# Altium schematic sheet SkeinTwisterRevE.SchDoc
size A
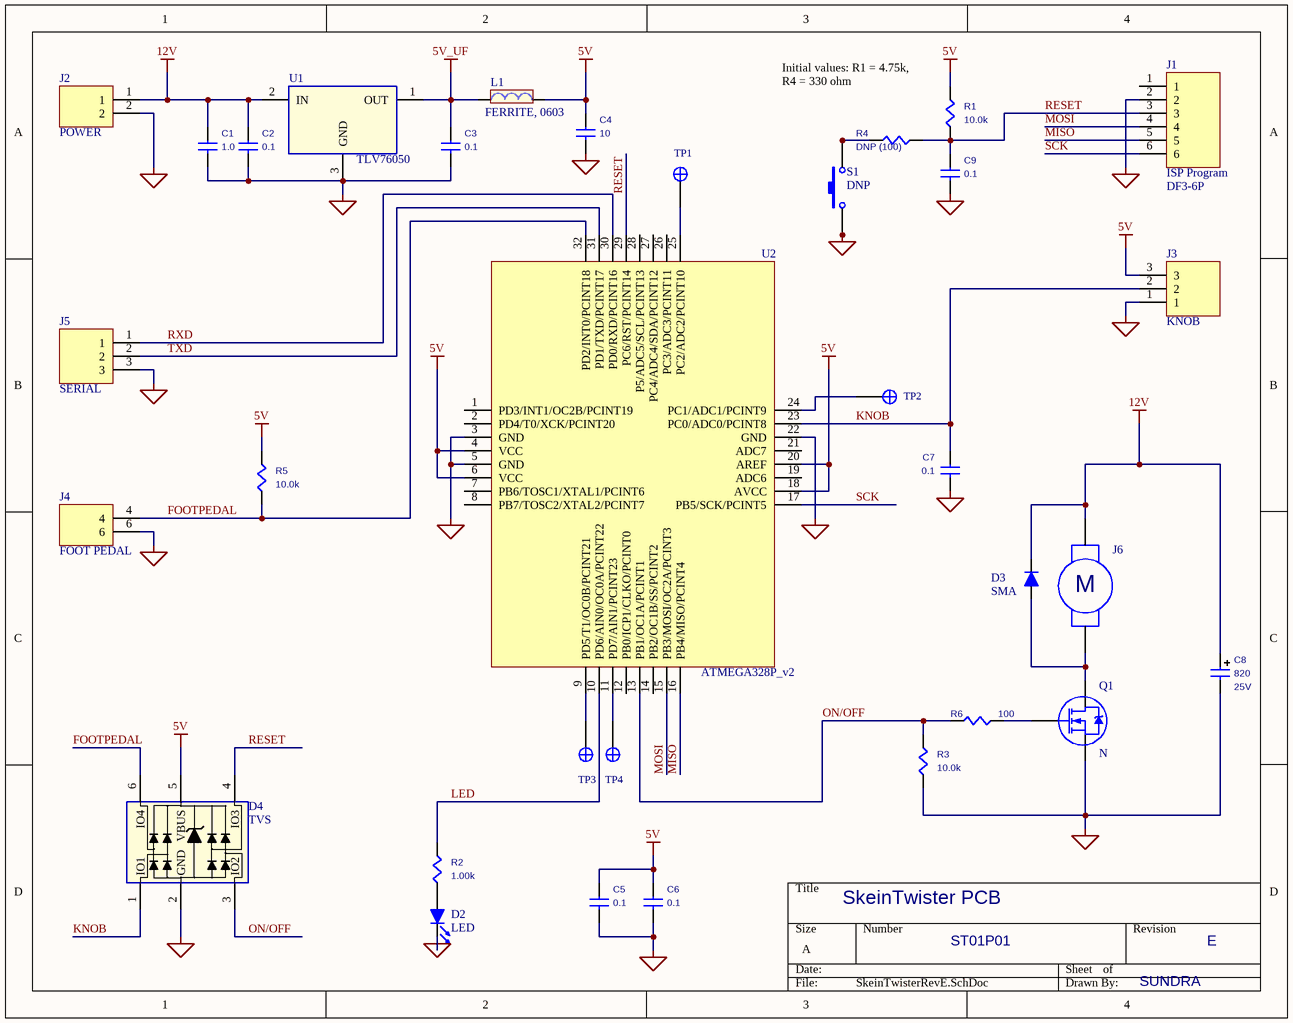
[diagram p0: SkeinTwisterRevE.SchDoc]

## Parts
C1  1.0  [0603]
C2  0.1  [0603]
C3  0.1  [0603]
C4  10  [0603]
C5  0.1  [0603]
C6  0.1  [0603]
C7  0.1  [0603]
C8  820  Voltage: 25V  [CAP-10MM]
C9  0.1  [0603]
D2  LED  [0603+]
D3  value SMA  [SMA]  (hidden comment: DIODE, SM SIG)
D4  TVS  [SOT-363]
J1  ISP Program  Connector Series: DF3-6P  [DF13C-6P-1.25V]
J2  POWER  [CONN-JACK-2MM - slots]
J3  KNOB  [JST-XH-3]
J4  FOOT PEDAL  [AUDIO-6.35mm-rta]
J5  SERIAL  [DF13C-3P-1.25V]
J6  ?  [OSTTE021104]  (value not drawn)
L1  FERRITE, 0603  [0603]
Q1  N  [DFN8_3X3MM]
R1  10.0k  [0603]
R2  1.00k  [0603]
R3  10.0k  [0603]
R4  DNP (100)  [0603]
R5  10.0k  [0603]
R6  100  [0603]
S1  DNP  [PB-3.0X2.5-SMT]
TP1  TESTPOINT  [TP-1.0MM]  (value not drawn)
TP2  TESTPOINT  [TP-1.0MM]  (value not drawn)
TP3  TESTPOINT  [TP-1.0MM]  (value not drawn)
TP4  TESTPOINT  [TP-1.0MM]  (value not drawn)
U1  TLV76050  [SOT-23]
U2  ATMEGA328P_v2  [TQFP-32]

## Nets
5V: C4.1 C5.1 C6.1 D4.5(VBUS) J3.3 L1.2 R1.2 R5.2 U2.4(VCC) U2.6(VCC) U2.18(AVCC) U2.20(AREF)
5V_UF: C3.1 L1.1 U1.1(OUT)
12V: C1.1 C2.1 C8.1 D3.K J2.1 J6.1 U1.2(IN)
GND: C1.2 C2.2 C3.2 C4.2 C5.2 C6.2 C7.2 C8.2 C9.2 D2.2 D4.2(GND) J1.2 J2.2 J3.1 J4.6 J5.3 Q1.S R3.1 S1.1 U1.3(GND) U2.3(GND) U2.5(GND) U2.22(GND)
FOOTPEDAL: D4.6(IO4) J4.4 R5.1 U2.32(PD2/INT0/PCINT18)
KNOB: C7.1 D4.1(IO1) J3.2 U2.23(PC0/ADC0/PCINT8)
LED: R2.2 U2.10(PD6/AIN0/OC0A/PCINT22)
MISO: J1.5 U2.16(PB4/MISO/PCINT4)
MOSI: J1.4 U2.15(PB3/MOSI/OC2A/PCINT3)
ON/OFF: D4.3(IO2) R3.2 R6.2 U2.13(PB1/OC1A/PCINT1)
RESET: C9.1 D4.4(IO3) J1.3 R1.1 R4.1 U2.29(PC6/RST/PCINT14)
RXD: J5.1 U2.30(PD0/RXD/PCINT16)
SCK: J1.6 U2.17(PB5/SCK/PCINT5)
TXD: J5.2 U2.31(PD1/TXD/PCINT17)
NetD2_1: D2.1 R2.1
NetD3_A: D3.A J6.2 Q1.D
NetQ1_G: Q1.G R6.1
NetR4_2: R4.2 S1.2
NetTP1_1: TP1.1 U2.25(PC2/ADC2/PCINT10)
NetTP2_1: TP2.1 U2.24(PC1/ADC1/PCINT9)
NetTP3_1: TP3.1 U2.9(PD5/T1/OC0B/PCINT21)
NetTP4_1: TP4.1 U2.11(PD7/AIN1/PCINT23)

Not connected (* = marked no-connect by the designer): J1 1; U2 1(PD3/INT1/OC2B/PCINT19) 2(PD4/T0/XCK/PCINT20) 7(PB6/TOSC1/XTAL1/PCINT6) 8(PB7/TOSC2/XTAL2/PCINT7) 12(PB0/ICP1/CLKO/PCINT0) 14(PB2/OC1B/SS/PCINT2) 19(ADC6) 21(ADC7) 26(PC3/ADC3/PCINT11) 27(PC4/ADC4/SDA/PCINT12) 28(P5/ADC5/SCL/PCINT13)

## Notes on the sheet
- Initial values: R1 = 4.75k, R4 = 330 ohm
- SkeinTwister PCB
- ST01P01
- E
- SUNDRA
- (in symbol Motor) M

## Library data of the parts
C1-C7 C9 = CAP: Voltage: *; Comments: *; Temp Rating: *
C8 = CAP+: Comments: *; Temp Rating: *
D4 = TVS, USB
J1 = CONN-6
J2 J4 = CONN-2
J3 J5 = CONN-3
J6 = Motor
Q1 = FET-N, SOT23: N-Channel MOSFET
R1-R6 = RES
S1 = SW-PB: Switch; Published: 24-Mar-1999; LatestRevisionDate: 17-Jul-2002; LatestRevisionNote: Re-released for DXP Platform.; PackageReference: SPST-2; Publisher: Altium Limited; PackageDescription: Switch; 2 Leads
U1 = TLV760